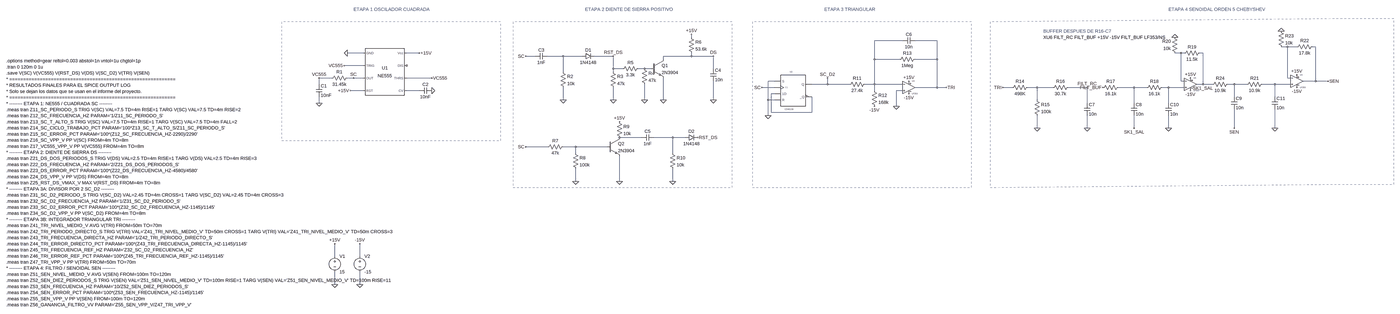
[diagram p0: schematic EsquematicoSintetizador.asc, whole sheet]
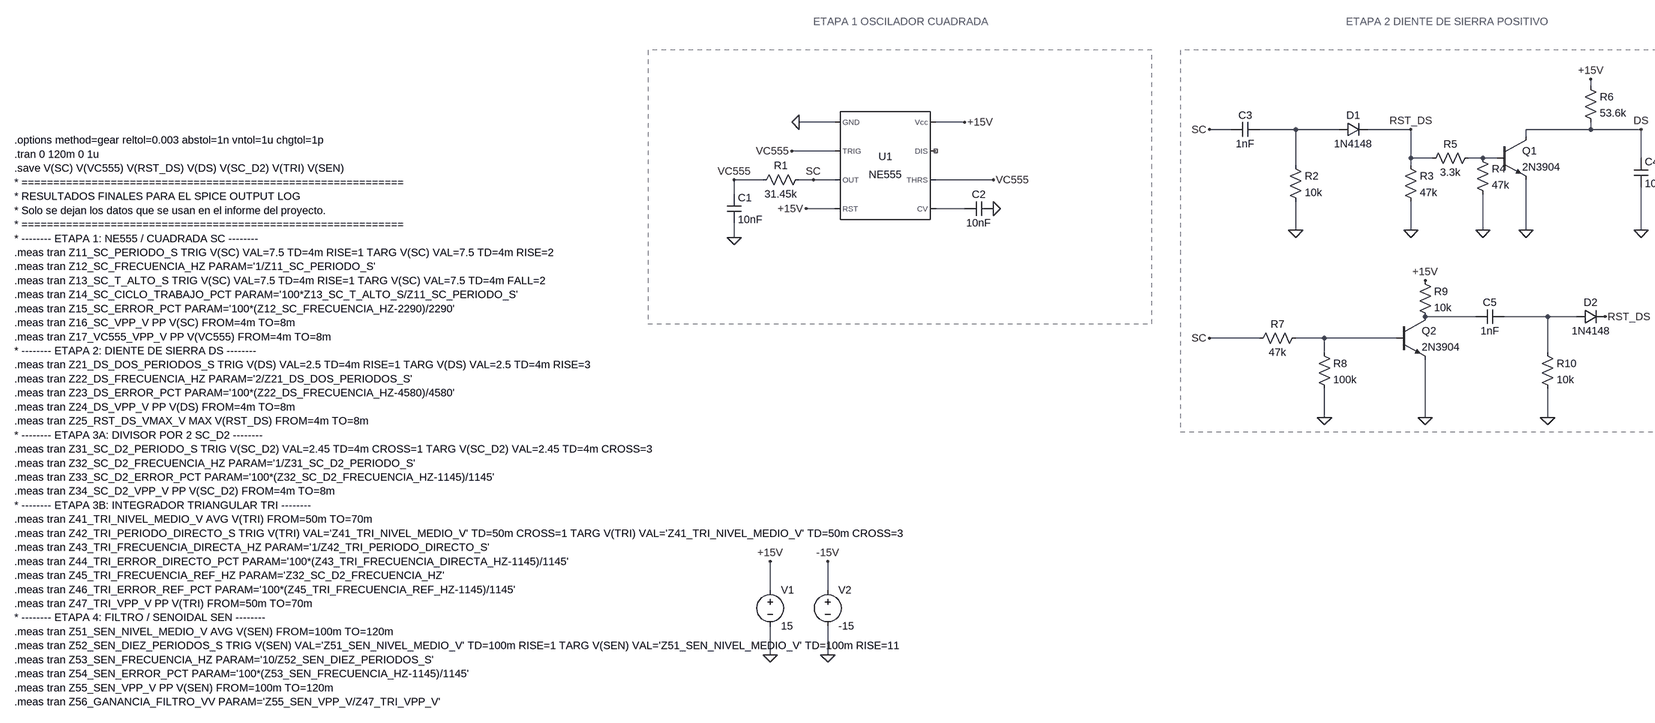
[diagram p1: schematic EsquematicoSintetizador.asc, part, row 1 of 1, column 1 of 2]
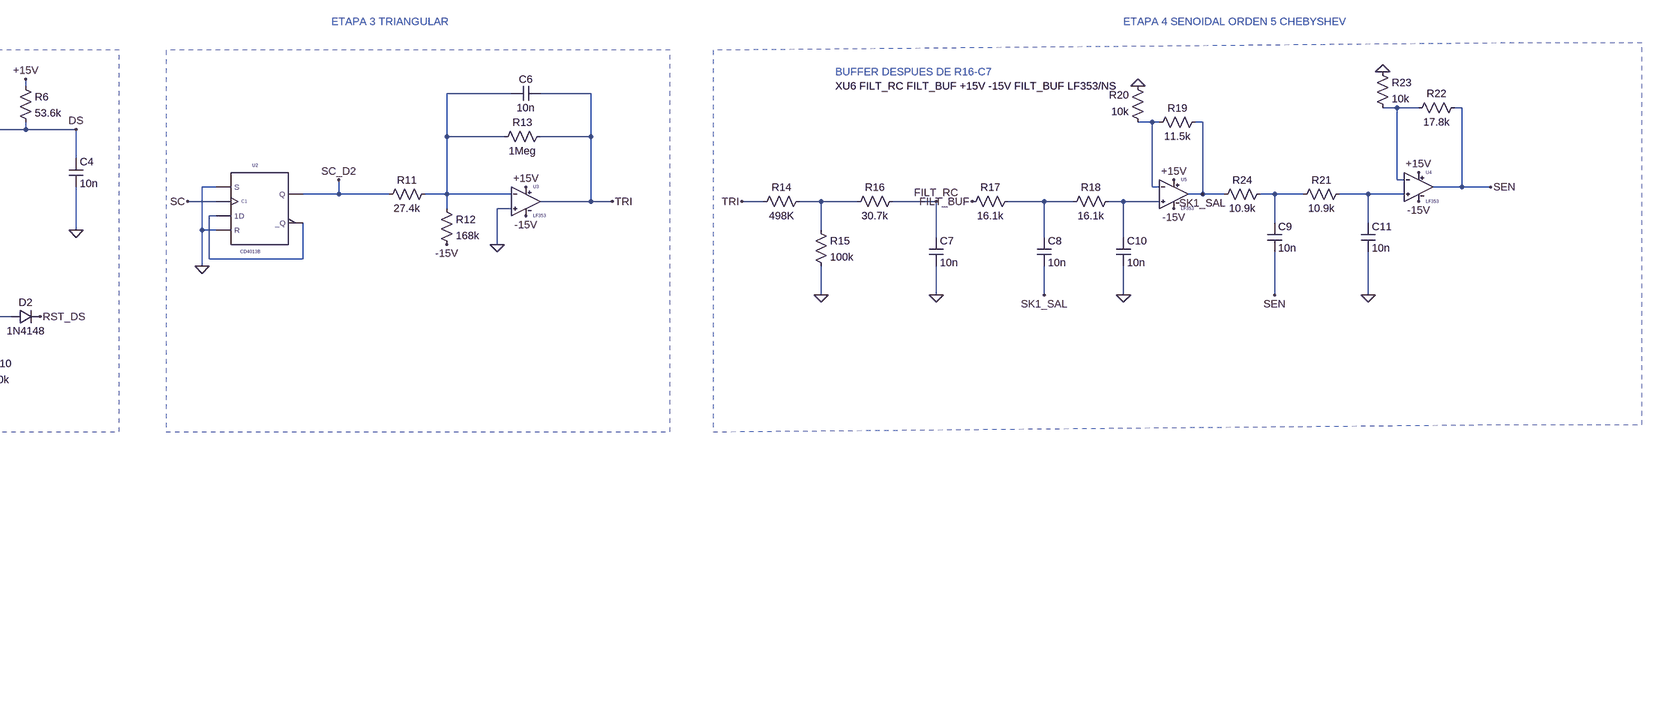
[diagram p2: schematic EsquematicoSintetizador.asc, part, row 1 of 1, column 2 of 2]
EsquematicoSintetizador.asc, the LTspice schematic file:
Version 4.1
SHEET 1 4820 2216
WIRE 1216 -720 1216 -736
WIRE 2304 -704 2160 -704
WIRE 2480 -704 2368 -704
WIRE 4272 -672 4240 -672
WIRE 4320 -672 4272 -672
WIRE 4416 -672 4400 -672
WIRE -464 -640 -544 -640
WIRE -176 -640 -240 -640
WIRE 3728 -640 3696 -640
WIRE 3744 -640 3728 -640
WIRE 3840 -640 3824 -640
WIRE 416 -624 368 -624
WIRE 560 -624 480 -624
WIRE 656 -624 560 -624
WIRE 816 -624 720 -624
WIRE 1216 -624 1216 -640
WIRE 1216 -624 1072 -624
WIRE 1328 -624 1216 -624
WIRE 1072 -608 1072 -624
WIRE 2160 -608 2160 -704
WIRE 2288 -608 2160 -608
WIRE 2480 -608 2480 -704
WIRE 2480 -608 2368 -608
WIRE -464 -576 -560 -576
WIRE 816 -560 816 -624
WIRE 864 -560 816 -560
WIRE 976 -560 944 -560
WIRE 1008 -560 976 -560
WIRE 1328 -560 1328 -624
WIRE 560 -544 560 -624
WIRE 816 -544 816 -560
WIRE -624 -512 -688 -512
WIRE -512 -512 -544 -512
WIRE -464 -512 -512 -512
WIRE -112 -512 -240 -512
WIRE 4272 -512 4272 -672
WIRE 4288 -512 4272 -512
WIRE 1648 -496 1616 -496
WIRE 3728 -496 3728 -640
WIRE 3744 -496 3728 -496
WIRE 4416 -496 4416 -672
WIRE 4416 -496 4352 -496
WIRE 4480 -496 4416 -496
WIRE -688 -480 -688 -512
WIRE 1920 -480 1920 -512
WIRE 1920 -480 1840 -480
WIRE 2032 -480 1920 -480
WIRE 2160 -480 2160 -608
WIRE 2160 -480 2112 -480
WIRE 2304 -480 2160 -480
WIRE 3840 -480 3840 -640
WIRE 3840 -480 3808 -480
WIRE 3888 -480 3840 -480
WIRE 4000 -480 3968 -480
WIRE 4064 -480 4000 -480
WIRE 4208 -480 4144 -480
WIRE 4288 -480 4208 -480
WIRE 1648 -464 1584 -464
WIRE 2480 -464 2480 -608
WIRE 2480 -464 2368 -464
WIRE 2528 -464 2480 -464
WIRE 2864 -464 2816 -464
WIRE 2992 -464 2944 -464
WIRE 3072 -464 2992 -464
WIRE 3248 -464 3152 -464
WIRE 3488 -464 3408 -464
WIRE 3552 -464 3488 -464
WIRE 3664 -464 3632 -464
WIRE 3744 -464 3664 -464
WIRE -464 -448 -528 -448
WIRE -176 -448 -240 -448
WIRE 2160 -448 2160 -480
WIRE 2304 -448 2272 -448
WIRE 1648 -432 1632 -432
WIRE 4000 -416 4000 -480
WIRE 4208 -416 4208 -480
WIRE 560 -400 560 -464
WIRE 816 -400 816 -464
WIRE 976 -400 976 -480
WIRE 1072 -400 1072 -512
WIRE 1328 -400 1328 -496
WIRE 1616 -400 1616 -496
WIRE 1648 -400 1616 -400
WIRE 2992 -400 2992 -464
WIRE -688 -384 -688 -416
WIRE 3248 -384 3248 -464
WIRE 3488 -384 3488 -464
WIRE 3664 -384 3664 -464
WIRE 2272 -368 2272 -448
WIRE 1632 -336 1632 -432
WIRE 1840 -336 1840 -416
WIRE 1840 -336 1632 -336
WIRE 1616 -320 1616 -400
WIRE 2992 -256 2992 -320
WIRE 3248 -256 3248 -320
WIRE 3488 -256 3488 -320
WIRE 3664 -256 3664 -320
WIRE 4000 -256 4000 -352
WIRE 4208 -256 4208 -352
WIRE 960 -208 848 -208
WIRE 1120 -208 1024 -208
WIRE 1184 -208 1120 -208
WIRE 480 -160 368 -160
WIRE 624 -160 560 -160
WIRE 784 -160 624 -160
WIRE 624 -128 624 -160
WIRE 1120 -128 1120 -208
WIRE 624 16 624 -48
WIRE 848 16 848 -112
WIRE 1120 16 1120 -48
WIRE -608 400 -608 336
WIRE -480 400 -480 336
WIRE -608 544 -608 480
WIRE -480 544 -480 480
FLAG -544 -640 0
FLAG -688 -384 0
FLAG -608 544 0
FLAG -480 544 0
FLAG -608 336 +15V
FLAG -480 336 -15V
FLAG -528 -448 +15V
FLAG -112 -448 0
FLAG -112 -512 VC555
FLAG -176 -640 +15V
FLAG -560 -576 VC555
FLAG -688 -512 VC555
FLAG -512 -512 SC
FLAG 560 -400 0
FLAG 816 -400 0
FLAG 368 -624 SC
FLAG 1072 -400 0
FLAG 1328 -624 DS
FLAG 1328 -400 0
FLAG 1216 -736 +15V
FLAG 976 -400 0
FLAG 368 -160 SC
FLAG 624 16 0
FLAG 848 16 0
FLAG 848 -288 +15V
FLAG 1120 16 0
FLAG 816 -624 RST_DS
FLAG 1248 -208 RST_DS
FLAG 1584 -464 SC
FLAG 1616 -320 0
FLAG 1920 -512 SC_D2
FLAG 2160 -368 -15V
FLAG 2336 -432 -15V
FLAG 2336 -496 +15V
FLAG 2272 -368 0
FLAG 2528 -464 TRI
FLAG 2816 -464 TRI
FLAG 2992 -256 0
FLAG 3248 -256 0
FLAG 3248 -464 FILT_RC
FLAG 3328 -464 FILT_BUF
FLAG 3488 -256 SK1_SAL
FLAG 3776 -448 -15V
FLAG 3776 -512 +15V
FLAG 3696 -720 0
FLAG 4000 -256 SEN
FLAG 4320 -464 -15V
FLAG 4320 -528 +15V
FLAG 4240 -752 0
FLAG 4480 -496 SEN
FLAG 3664 -256 0
FLAG 3840 -480 SK1_SAL
FLAG 4208 -256 0
SYMBOL Misc\\NE555 -352 -544 R0
SYMATTR InstName U1
SYMATTR ModelFile modelos/NE555.sub
SYMBOL res -528 -528 R90
WINDOW 0 0 56 VBottom 2
WINDOW 3 32 56 VTop 2
SYMATTR InstName R1
SYMATTR Value 31.45k
SYMBOL cap -704 -480 R0
SYMATTR InstName C1
SYMATTR Value 10nF
SYMBOL voltage -608 384 R0
WINDOW 123 0 0 Left 0
WINDOW 39 0 0 Left 0
SYMATTR InstName V1
SYMATTR Value 15
SYMBOL voltage -480 384 R0
WINDOW 123 0 0 Left 0
WINDOW 39 0 0 Left 0
SYMATTR InstName V2
SYMATTR Value -15
SYMBOL cap -112 -464 R90
WINDOW 0 0 32 VBottom 2
WINDOW 3 32 32 VTop 2
SYMATTR InstName C2
SYMATTR Value 10nF
SYMBOL cap 480 -640 R90
WINDOW 0 0 32 VBottom 2
WINDOW 3 32 32 VTop 2
SYMATTR InstName C3
SYMATTR Value 1nF
SYMBOL res 544 -560 R0
SYMATTR InstName R2
SYMATTR Value 10k
SYMBOL diode 656 -608 R270
WINDOW 0 32 32 VTop 2
WINDOW 3 0 32 VBottom 2
SYMATTR InstName D1
SYMATTR Value 1N4148
SYMBOL res 800 -560 R0
SYMATTR InstName R3
SYMATTR Value 47k
SYMBOL res 848 -544 R270
WINDOW 0 32 56 VTop 2
WINDOW 3 0 56 VBottom 2
SYMATTR InstName R5
SYMATTR Value 3.3k
SYMBOL npn 1008 -608 R0
SYMATTR InstName Q1
SYMATTR Value 2N3904
SYMBOL cap 1312 -560 R0
SYMATTR InstName C4
SYMATTR Value 10n
SYMBOL res 1200 -736 R0
SYMATTR InstName R6
SYMATTR Value 53.6k
SYMBOL res 960 -576 R0
SYMATTR InstName R4
SYMATTR Value 47k
SYMBOL res 576 -176 R90
WINDOW 0 0 56 VBottom 2
WINDOW 3 32 56 VTop 2
SYMATTR InstName R7
SYMATTR Value 47k
SYMBOL res 608 -144 R0
SYMATTR InstName R8
SYMATTR Value 100k
SYMBOL npn 784 -208 R0
SYMATTR InstName Q2
SYMATTR Value 2N3904
SYMBOL res 832 -304 R0
SYMATTR InstName R9
SYMATTR Value 10k
SYMBOL cap 1024 -224 R90
WINDOW 0 0 32 VBottom 2
WINDOW 3 32 32 VTop 2
SYMATTR InstName C5
SYMATTR Value 1nF
SYMBOL res 1104 -144 R0
SYMATTR InstName R10
SYMATTR Value 10k
SYMBOL diode 1184 -192 R270
WINDOW 0 32 32 VTop 2
WINDOW 3 0 32 VBottom 2
SYMATTR InstName D2
SYMATTR Value 1N4148
SYMBOL res 2128 -496 R90
WINDOW 0 0 56 VBottom 2
WINDOW 3 32 56 VTop 2
SYMATTR InstName R11
SYMATTR Value 27.4k
SYMBOL res 2144 -464 R0
SYMATTR InstName R12
SYMATTR Value 168k
SYMBOL UserLibs\\LTwiki\\lf353_ns 2336 -528 R0
SYMATTR InstName U3
SYMATTR ModelFile modelos/LF353.mod
SYMBOL cap 2368 -720 R90
WINDOW 0 0 32 VBottom 2
WINDOW 3 32 32 VTop 2
SYMATTR InstName C6
SYMATTR Value 10n
SYMBOL res 2272 -592 R270
WINDOW 0 32 56 VTop 2
WINDOW 3 0 56 VBottom 2
SYMATTR InstName R13
SYMATTR Value 1Meg
SYMBOL UserLibs\\LTwiki\\CD4013B.i 1744 -560 R0
SYMATTR InstName U2
SYMATTR ModelFile modelos/CD4000.lib
SYMBOL res 2960 -480 R90
WINDOW 0 0 56 VBottom 2
WINDOW 3 32 56 VTop 2
SYMATTR InstName R14
SYMATTR Value 498K
SYMBOL res 2976 -416 R0
SYMATTR InstName R15
SYMATTR Value 100k
SYMBOL res 3168 -480 R90
WINDOW 0 0 56 VBottom 2
WINDOW 3 32 56 VTop 2
SYMATTR InstName R16
SYMATTR Value 30.7k
SYMBOL cap 3232 -384 R0
SYMATTR InstName C7
SYMATTR Value 10n
SYMBOL res 3424 -480 R90
WINDOW 0 0 56 VBottom 2
WINDOW 3 32 56 VTop 2
SYMATTR InstName R17
SYMATTR Value 16.1k
SYMBOL cap 3472 -384 R0
SYMATTR InstName C8
SYMATTR Value 10n
SYMBOL res 3648 -480 R90
WINDOW 0 0 56 VBottom 2
WINDOW 3 32 56 VTop 2
SYMATTR InstName R18
SYMATTR Value 16.1k
SYMBOL UserLibs\\LTwiki\\lf353_ns 3776 -544 R0
SYMATTR InstName U5
SYMATTR ModelFile modelos/LF353.mod
SYMBOL res 3840 -656 R90
WINDOW 0 0 56 VBottom 2
WINDOW 3 32 56 VTop 2
SYMATTR InstName R19
SYMATTR Value 11.5k
SYMBOL res 3712 -624 R180
WINDOW 0 36 76 Left 2
WINDOW 3 36 40 Left 2
SYMATTR InstName R20
SYMATTR Value 10k
SYMBOL cap 3984 -416 R0
SYMATTR InstName C9
SYMATTR Value 10n
SYMBOL res 4160 -496 R90
WINDOW 0 0 56 VBottom 2
WINDOW 3 32 56 VTop 2
SYMATTR InstName R21
SYMATTR Value 10.9k
SYMBOL UserLibs\\LTwiki\\lf353_ns 4320 -560 R0
SYMATTR InstName U4
SYMATTR ModelFile modelos/LF353.mod
SYMBOL res 4416 -688 R90
WINDOW 0 0 56 VBottom 2
WINDOW 3 32 56 VTop 2
SYMATTR InstName R22
SYMATTR Value 17.8k
SYMBOL res 4224 -768 R0
SYMATTR InstName R23
SYMATTR Value 10k
SYMBOL res 3984 -496 R90
WINDOW 0 0 56 VBottom 2
WINDOW 3 32 56 VTop 2
SYMATTR InstName R24
SYMATTR Value 10.9k
SYMBOL cap 3648 -384 R0
SYMATTR InstName C10
SYMATTR Value 10n
SYMBOL cap 4192 -416 R0
SYMATTR InstName C11
SYMATTR Value 10n
TEXT -512 -864 Left 2 ;ETAPA 1 OSCILADOR CUADRADA
TEXT -2288 -600 Left 2 !.options method=gear reltol=0.003 abstol=1n vntol=1u chgtol=1p\n.tran 0 120m 0 1u\n.save V(SC) V(VC555) V(RST_DS) V(DS) V(SC_D2) V(TRI) V(SEN)\n* ============================================================\n* RESULTADOS FINALES PARA EL SPICE OUTPUT LOG\n* Solo se dejan los datos que se usan en el informe del proyecto.\n* ============================================================\n* -------- ETAPA 1: NE555 / CUADRADA SC --------\n.meas tran Z11_SC_PERIODO_S TRIG V(SC) VAL=7.5 TD=4m RISE=1 TARG V(SC) VAL=7.5 TD=4m RISE=2\n.meas tran Z12_SC_FRECUENCIA_HZ PARAM='1/Z11_SC_PERIODO_S'\n.meas tran Z13_SC_T_ALTO_S TRIG V(SC) VAL=7.5 TD=4m RISE=1 TARG V(SC) VAL=7.5 TD=4m FALL=2\n.meas tran Z14_SC_CICLO_TRABAJO_PCT PARAM='100*Z13_SC_T_ALTO_S/Z11_SC_PERIODO_S'\n.meas tran Z15_SC_ERROR_PCT PARAM='100*(Z12_SC_FRECUENCIA_HZ-2290)/2290'\n.meas tran Z16_SC_VPP_V PP V(SC) FROM=4m TO=8m\n.meas tran Z17_VC555_VPP_V PP V(VC555) FROM=4m TO=8m\n* -------- ETAPA 2: DIENTE DE SIERRA DS --------\n.meas tran Z21_DS_DOS_PERIODOS_S TRIG V(DS) VAL=2.5 TD=4m RISE=1 TARG V(DS) VAL=2.5 TD=4m RISE=3\n.meas tran Z22_DS_FRECUENCIA_HZ PARAM='2/Z21_DS_DOS_PERIODOS_S'\n.meas tran Z23_DS_ERROR_PCT PARAM='100*(Z22_DS_FRECUENCIA_HZ-4580)/4580'\n.meas tran Z24_DS_VPP_V PP V(DS) FROM=4m TO=8m\n.meas tran Z25_RST_DS_VMAX_V MAX V(RST_DS) FROM=4m TO=8m\n* -------- ETAPA 3A: DIVISOR POR 2 SC_D2 --------\n.meas tran Z31_SC_D2_PERIODO_S TRIG V(SC_D2) VAL=2.45 TD=4m CROSS=1 TARG V(SC_D2) VAL=2.45 TD=4m CROSS=3\n.meas tran Z32_SC_D2_FRECUENCIA_HZ PARAM='1/Z31_SC_D2_PERIODO_S'\n.meas tran Z33_SC_D2_ERROR_PCT PARAM='100*(Z32_SC_D2_FRECUENCIA_HZ-1145)/1145'\n.meas tran Z34_SC_D2_VPP_V PP V(SC_D2) FROM=4m TO=8m\n* -------- ETAPA 3B: INTEGRADOR TRIANGULAR TRI --------\n.meas tran Z41_TRI_NIVEL_MEDIO_V AVG V(TRI) FROM=50m TO=70m\n.meas tran Z42_TRI_PERIODO_DIRECTO_S TRIG V(TRI) VAL='Z41_TRI_NIVEL_MEDIO_V' TD=50m CROSS=1 TARG V(TRI) VAL='Z41_TRI_NIVEL_MEDIO_V' TD=50m CROSS=3\n.meas tran Z43_TRI_FRECUENCIA_DIRECTA_HZ PARAM='1/Z42_TRI_PERIODO_DIRECTO_S'\n.meas tran Z44_TRI_ERROR_DIRECTO_PCT PARAM='100*(Z43_TRI_FRECUENCIA_DIRECTA_HZ-1145)/1145'\n.meas tran Z45_TRI_FRECUENCIA_REF_HZ PARAM='Z32_SC_D2_FRECUENCIA_HZ'\n.meas tran Z46_TRI_ERROR_REF_PCT PARAM='100*(Z45_TRI_FRECUENCIA_REF_HZ-1145)/1145'\n.meas tran Z47_TRI_VPP_V PP V(TRI) FROM=50m TO=70m\n* -------- ETAPA 4: FILTRO / SENOIDAL SEN --------\n.meas tran Z51_SEN_NIVEL_MEDIO_V AVG V(SEN) FROM=100m TO=120m\n.meas tran Z52_SEN_DIEZ_PERIODOS_S TRIG V(SEN) VAL='Z51_SEN_NIVEL_MEDIO_V' TD=100m RISE=1 TARG V(SEN) VAL='Z51_SEN_NIVEL_MEDIO_V' TD=100m RISE=11\n.meas tran Z53_SEN_FRECUENCIA_HZ PARAM='10/Z52_SEN_DIEZ_PERIODOS_S'\n.meas tran Z54_SEN_ERROR_PCT PARAM='100*(Z53_SEN_FRECUENCIA_HZ-1145)/1145'\n.meas tran Z55_SEN_VPP_V PP V(SEN) FROM=100m TO=120m\n.meas tran Z56_GANANCIA_FILTRO_VV PARAM='Z55_SEN_VPP_V/Z47_TRI_VPP_V'
TEXT 672 -864 Left 2 ;ETAPA 2 DIENTE DE SIERRA POSITIVO
TEXT 1904 -864 Left 2 ;ETAPA 3 TRIANGULAR
TEXT 3024 -752 Left 2 ;BUFFER DESPUES DE R16-C7
TEXT 3024 -720 Left 2 !XU6 FILT_RC FILT_BUF +15V -15V FILT_BUF LF353/NS
TEXT 3664 -864 Left 2 ;ETAPA 4 SENOIDAL ORDEN 5 CHEBYSHEV
LINE Normal 240 -800 -880 -800 2
LINE Normal 240 -192 240 -800 2
LINE Normal -880 -192 240 -192 2
LINE Normal -880 -800 -880 -192 2
LINE Normal 1424 -800 304 -800 2
LINE Normal 1424 48 1424 -800 2
LINE Normal 304 48 1424 48 2
LINE Normal 304 -800 304 48 2
LINE Normal 2656 -800 1536 -800 2
LINE Normal 2656 48 2656 -800 2
LINE Normal 1536 48 2656 48 2
LINE Normal 1536 -800 1536 48 2
LINE Normal 4512 -816 2752 -800 2
LINE Normal 2752 48 4512 32 2
LINE Normal 2752 -800 2752 48 2
LINE Normal 4816 -816 4512 -816 2
LINE Normal 4816 32 4816 -816 2
LINE Normal 4512 32 4816 32 2

The netlist it stands for:
* EsquematicoSintetizador.asc
X§U1 0 VC555 SC +15V N011 VC555 NC_01 +15V NE555  ; pins GND TRIG OUT RST CV THRS DIS Vcc
R1 SC VC555 31.45k
C1 VC555 0 10nF
V1 +15V 0 15
V2 -15V 0 -15
C2 0 N011 10nF
C3 N004 SC 1nF
R2 N004 0 10k
D1 N004 RST_DS 1N4148
R3 RST_DS 0 47k
R5 RST_DS N005 3.3k
Q1 DS N005 0 0 2N3904
C4 DS 0 10n
R6 +15V DS 53.6k
R4 N005 0 47k
R7 N015 SC 47k
R8 N015 0 100k
Q2 N013 N015 0 0 2N3904
R9 +15V N013 10k
C5 N014 N013 1nF
R10 N014 0 10k
D2 N014 RST_DS 1N4148
R11 N001 SC_D2 27.4k
R12 N001 -15V 168k
X§U3 0 N001 +15V -15V TRI LF353.mod LF353 LF353/NS  ; pins In+ In- V+ V- OUT
C6 TRI N001 10n
R13 N001 TRI 1Meg
X§U2 0 SC N012 0 SC_D2 N012 VDD 0 CD4013B VDD=5  SPEED=1.0  TRIPDT=5e-9  ; pins S C1 1D R Q _Q
R14 N008 TRI 498K
R15 N008 0 100k
R16 FILT_RC N008 30.7k
C7 FILT_RC 0 10n
R17 N009 FILT_BUF 16.1k
C8 N009 SK1_SAL 10n
R18 N010 N009 16.1k
X§U5 N010 N003 +15V -15V SK1_SAL LF353.mod LF353 LF353/NS  ; pins In+ In- V+ V- OUT
R19 SK1_SAL N003 11.5k
R20 N003 0 10k
C9 N006 SEN 10n
R21 N007 N006 10.9k
X§U4 N007 N002 +15V -15V SEN LF353.mod LF353 LF353/NS  ; pins In+ In- V+ V- OUT
R22 SEN N002 17.8k
R23 0 N002 10k
R24 N006 SK1_SAL 10.9k
C10 N010 0 10n
C11 N007 0 10n
.model D D
.lib standard.dio
.model NPN NPN
.model PNP PNP
.lib standard.bjt
* ETAPA 1 OSCILADOR CUADRADA
.options method=gear reltol=0.003 abstol=1n vntol=1u chgtol=1p
.tran 0 120m 0 1u
.save V(SC) V(VC555) V(RST_DS) V(DS) V(SC_D2) V(TRI) V(SEN)
* ============================================================
* RESULTADOS FINALES PARA EL SPICE OUTPUT LOG
* Solo se dejan los datos que se usan en el informe del proyecto.
* ============================================================
* -------- ETAPA 1: NE555 / CUADRADA SC --------
.meas tran Z11_SC_PERIODO_S TRIG V(SC) VAL=7.5 TD=4m RISE=1 TARG V(SC) VAL=7.5 TD=4m RISE=2
.meas tran Z12_SC_FRECUENCIA_HZ PARAM='1/Z11_SC_PERIODO_S'
.meas tran Z13_SC_T_ALTO_S TRIG V(SC) VAL=7.5 TD=4m RISE=1 TARG V(SC) VAL=7.5 TD=4m FALL=2
.meas tran Z14_SC_CICLO_TRABAJO_PCT PARAM='100*Z13_SC_T_ALTO_S/Z11_SC_PERIODO_S'
.meas tran Z15_SC_ERROR_PCT PARAM='100*(Z12_SC_FRECUENCIA_HZ-2290)/2290'
.meas tran Z16_SC_VPP_V PP V(SC) FROM=4m TO=8m
.meas tran Z17_VC555_VPP_V PP V(VC555) FROM=4m TO=8m
* -------- ETAPA 2: DIENTE DE SIERRA DS --------
.meas tran Z21_DS_DOS_PERIODOS_S TRIG V(DS) VAL=2.5 TD=4m RISE=1 TARG V(DS) VAL=2.5 TD=4m RISE=3
.meas tran Z22_DS_FRECUENCIA_HZ PARAM='2/Z21_DS_DOS_PERIODOS_S'
.meas tran Z23_DS_ERROR_PCT PARAM='100*(Z22_DS_FRECUENCIA_HZ-4580)/4580'
.meas tran Z24_DS_VPP_V PP V(DS) FROM=4m TO=8m
.meas tran Z25_RST_DS_VMAX_V MAX V(RST_DS) FROM=4m TO=8m
* -------- ETAPA 3A: DIVISOR POR 2 SC_D2 --------
.meas tran Z31_SC_D2_PERIODO_S TRIG V(SC_D2) VAL=2.45 TD=4m CROSS=1 TARG V(SC_D2) VAL=2.45 TD=4m CROSS=3
.meas tran Z32_SC_D2_FRECUENCIA_HZ PARAM='1/Z31_SC_D2_PERIODO_S'
.meas tran Z33_SC_D2_ERROR_PCT PARAM='100*(Z32_SC_D2_FRECUENCIA_HZ-1145)/1145'
.meas tran Z34_SC_D2_VPP_V PP V(SC_D2) FROM=4m TO=8m
* -------- ETAPA 3B: INTEGRADOR TRIANGULAR TRI --------
.meas tran Z41_TRI_NIVEL_MEDIO_V AVG V(TRI) FROM=50m TO=70m
.meas tran Z42_TRI_PERIODO_DIRECTO_S TRIG V(TRI) VAL='Z41_TRI_NIVEL_MEDIO_V' TD=50m CROSS=1 TARG V(TRI) VAL='Z41_TRI_NIVEL_MEDIO_V' TD=50m CROSS=3
.meas tran Z43_TRI_FRECUENCIA_DIRECTA_HZ PARAM='1/Z42_TRI_PERIODO_DIRECTO_S'
.meas tran Z44_TRI_ERROR_DIRECTO_PCT PARAM='100*(Z43_TRI_FRECUENCIA_DIRECTA_HZ-1145)/1145'
.meas tran Z45_TRI_FRECUENCIA_REF_HZ PARAM='Z32_SC_D2_FRECUENCIA_HZ'
.meas tran Z46_TRI_ERROR_REF_PCT PARAM='100*(Z45_TRI_FRECUENCIA_REF_HZ-1145)/1145'
.meas tran Z47_TRI_VPP_V PP V(TRI) FROM=50m TO=70m
* -------- ETAPA 4: FILTRO / SENOIDAL SEN --------
.meas tran Z51_SEN_NIVEL_MEDIO_V AVG V(SEN) FROM=100m TO=120m
.meas tran Z52_SEN_DIEZ_PERIODOS_S TRIG V(SEN) VAL='Z51_SEN_NIVEL_MEDIO_V' TD=100m RISE=1 TARG V(SEN) VAL='Z51_SEN_NIVEL_MEDIO_V' TD=100m RISE=11
.meas tran Z53_SEN_FRECUENCIA_HZ PARAM='10/Z52_SEN_DIEZ_PERIODOS_S'
.meas tran Z54_SEN_ERROR_PCT PARAM='100*(Z53_SEN_FRECUENCIA_HZ-1145)/1145'
.meas tran Z55_SEN_VPP_V PP V(SEN) FROM=100m TO=120m
.meas tran Z56_GANANCIA_FILTRO_VV PARAM='Z55_SEN_VPP_V/Z47_TRI_VPP_V'
* ETAPA 2 DIENTE DE SIERRA POSITIVO
* ETAPA 3 TRIANGULAR
* BUFFER DESPUES DE R16-C7
XU6 FILT_RC FILT_BUF +15V -15V FILT_BUF LF353/NS
* ETAPA 4 SENOIDAL ORDEN 5 CHEBYSHEV
.lib modelos/NE555.sub
.lib modelos/LF353.mod
.lib modelos/CD4000.lib
.backanno
.end